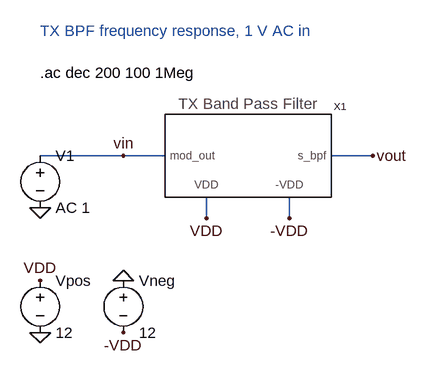
[diagram p0: schematic TX_BPF_AC.asc]
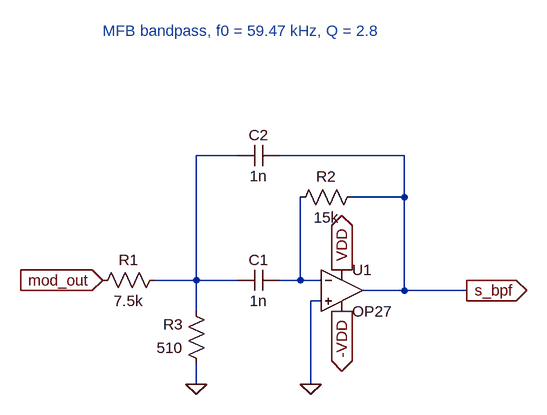
[diagram p1: sub-circuit band_pass_filter.asc]
TX_BPF_AC.asc, the LTspice schematic file:
Version 4.1
SHEET 1 1200 680
WIRE -320 0 -192 0
WIRE -192 0 -128 0
WIRE 128 0 192 0
WIRE -64 64 -64 96
WIRE 64 64 64 96
FLAG -192 0 vin
FLAG 192 0 vout
FLAG -64 96 VDD
FLAG 64 96 -VDD
FLAG -320 80 0
FLAG -320 192 VDD
FLAG -320 272 0
FLAG -192 192 0
FLAG -192 272 -VDD
SYMBOL Band_Pass_Filter 0 0 R0
SYMATTR InstName X1
SYMBOL voltage -320 -16 R0
WINDOW 123 0 0 Left 0
WINDOW 39 0 0 Left 0
SYMATTR InstName V1
SYMATTR Value AC 1
SYMBOL voltage -320 176 R0
WINDOW 123 0 0 Left 0
WINDOW 39 0 0 Left 0
SYMATTR InstName Vpos
SYMATTR Value 12
SYMBOL voltage -192 176 R0
WINDOW 123 0 0 Left 0
WINDOW 39 0 0 Left 0
SYMATTR InstName Vneg
SYMATTR Value 12
TEXT -320 -192 Left 2 ;TX BPF frequency response, 1 V AC in
TEXT -320 -128 Left 2 !.ac dec 200 100 1Meg

band_pass_filter.asc, the sub-circuit schematic file:
Version 4.1
SHEET 1 2756 680
WIRE 48 -480 -16 -480
WIRE 304 -480 112 -480
WIRE 304 -416 304 -480
WIRE 304 -416 224 -416
WIRE -16 -288 -16 -480
WIRE -16 -288 -80 -288
WIRE 48 -288 -16 -288
WIRE 144 -288 144 -416
WIRE 144 -288 112 -288
WIRE 176 -288 144 -288
WIRE 304 -272 304 -416
WIRE 304 -272 240 -272
WIRE 400 -272 304 -272
WIRE 176 -256 160 -256
WIRE -16 -240 -16 -288
WIRE -16 -128 -16 -160
WIRE 160 -128 160 -256
FLAG -16 -128 0
FLAG 160 -128 0
FLAG 400 -272 s_bpf
IOPIN 400 -272 Out
FLAG 208 -304 VDD
IOPIN 208 -304 Out
FLAG 208 -240 -VDD
IOPIN 208 -240 Out
FLAG -160 -288 mod_out
IOPIN -160 -288 In
SYMBOL OpAmps\\OP27 208 -336 R0
SYMATTR InstName U1
SYMBOL cap 112 -304 R90
WINDOW 0 0 32 VBottom 2
WINDOW 3 32 32 VTop 2
SYMATTR InstName C1
SYMATTR Value 1n
SYMBOL cap 112 -496 R90
WINDOW 0 0 32 VBottom 2
WINDOW 3 32 32 VTop 2
SYMATTR InstName C2
SYMATTR Value 1n
SYMBOL res -64 -304 R90
WINDOW 0 0 56 VBottom 2
WINDOW 3 32 56 VTop 2
SYMATTR InstName R1
SYMATTR Value 7.5k
SYMBOL res 240 -432 R90
WINDOW 0 0 56 VBottom 2
WINDOW 3 32 56 VTop 2
SYMATTR InstName R2
SYMATTR Value 15k
SYMBOL res 0 -144 R180
WINDOW 0 36 76 Left 2
WINDOW 3 36 40 Left 2
SYMATTR InstName R3
SYMATTR Value 510
TEXT -160 -672 Left 2 ;MFB bandpass, f0 = 59.47 kHz, Q = 2.8

The netlist it stands for:
* TX_BPF_AC.asc
X§X1 vin vout VDD -VDD band_pass_filter
V1 vin 0 AC 1
Vpos VDD 0 12
Vneg 0 -VDD 12

* block symbol definitions
.subckt band_pass_filter mod_out s_bpf VDD -VDD
X§U1 0 N002 VDD -VDD s_bpf OP27  ; pins In+ In- V+ V- OUT
C1 N002 N001 1n
C2 s_bpf N001 1n
R1 N001 mod_out 7.5k
R2 s_bpf N002 15k
R3 0 N001 510
* MFB bandpass, f0 = 59.47 kHz, Q = 2.8
.ends band_pass_filter

* TX BPF frequency response, 1 V AC in
.ac dec 200 100 1Meg
.lib ADI.lib
.backanno
.end